# Altium schematic sheet Altium_Schematic.schdoc (part 2 of 6)
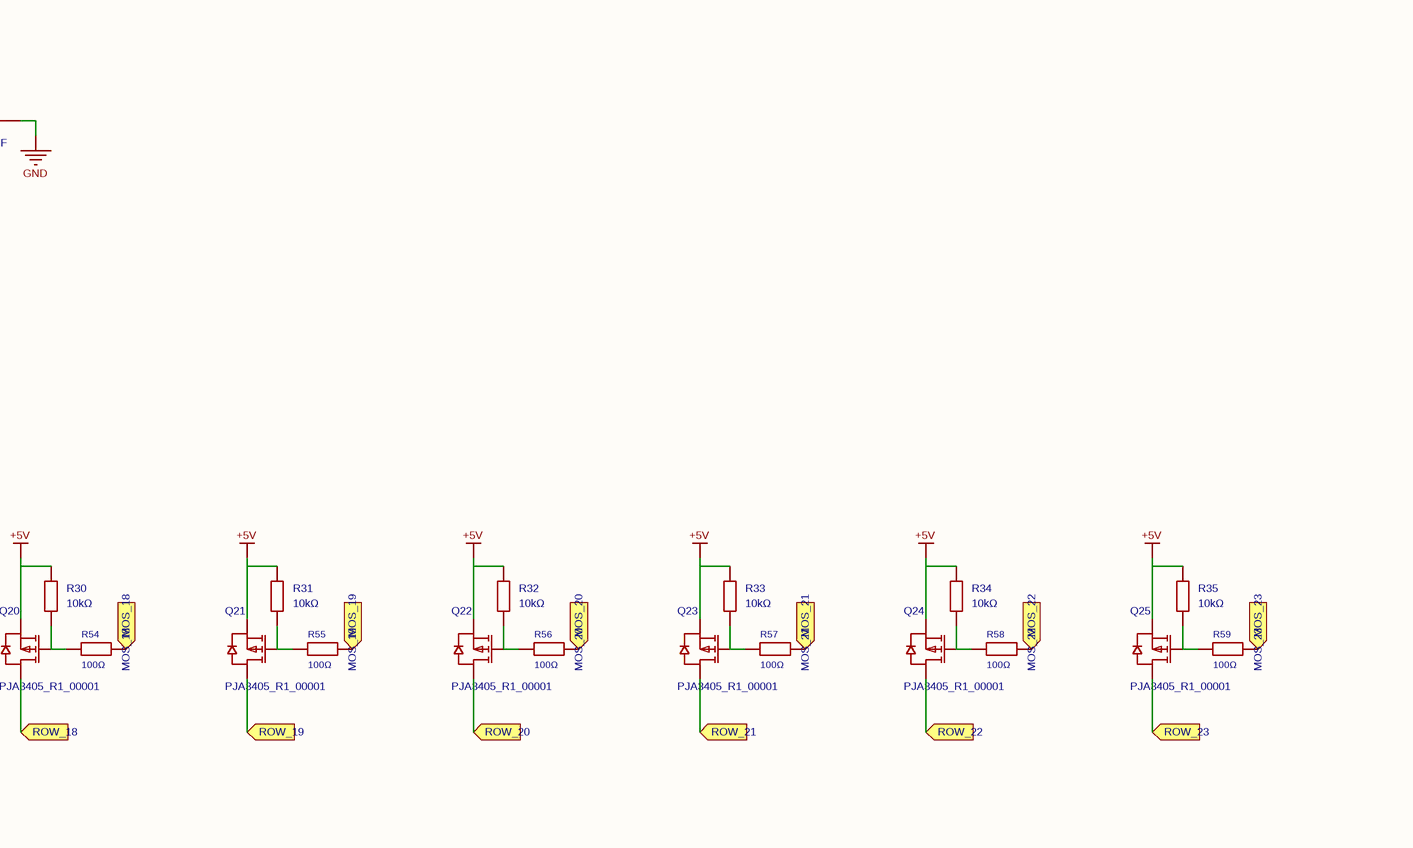
[diagram p12: Altium_Schematic.schdoc, bottom column 4 of 4]
## Parts
C1  1uF  [C0402]
C2  100nF  [C0402]
C3  1uF  [C0402]
C4  100nF  [C0402]
C5  100nF  [C0402]
C6  100nF  [C0402]
C7  100nF  [C0402]
C8  100nF  [C0402]
C9  1uF  [C0402]
C10  1uF  [C0402]
C11  1uF  [C0402]
C12  1uF  [C0402]
C13  1uF  [C0402]
C14  100nF  [C0402]
C15  100nF  [C0402]
C16  100nF  [C0402]
C17  10uF  [C0805]
C18  22uF  [C0805]
C19  10uF  [C0805]
C20  100nF  [C0402]
C21  100nF  [C0402]
D1  USBLC6-2SC6  [SOT-23-6_L2.9-W1.6-P0.95-LS2.8-BL]
H1  (no value)  [Top side pads]
H2  (no value)  [Top side pads]
LED1  16-213/BHC-AN1P2/3T  [LED0402-R-RD]  (value not drawn)
LED2  16-213/BHC-AN1P2/3T  [LED0402-R-RD]  (value not drawn)
LED3  16-213/BHC-AN1P2/3T  [LED0402-R-RD]  (value not drawn)
LED4  16-213/BHC-AN1P2/3T  [LED0402-R-RD]  (value not drawn)
LED5  16-213/BHC-AN1P2/3T  [LED0402-R-RD]  (value not drawn)
LED6  16-213/BHC-AN1P2/3T  [LED0402-R-RD]  (value not drawn)
LED7  16-213/BHC-AN1P2/3T  [LED0402-R-RD]  (value not drawn)
LED8  16-213/BHC-AN1P2/3T  [LED0402-R-RD]  (value not drawn)
LED9  16-213/BHC-AN1P2/3T  [LED0402-R-RD]  (value not drawn)
LED10  16-213/BHC-AN1P2/3T  [LED0402-R-RD]  (value not drawn)
LED11  16-213/BHC-AN1P2/3T  [LED0402-R-RD]  (value not drawn)
LED12  16-213/BHC-AN1P2/3T  [LED0402-R-RD]  (value not drawn)
LED13  16-213/BHC-AN1P2/3T  [LED0402-R-RD]  (value not drawn)
LED14  16-213/BHC-AN1P2/3T  [LED0402-R-RD]  (value not drawn)
LED15  16-213/BHC-AN1P2/3T  [LED0402-R-RD]  (value not drawn)
LED16  16-213/BHC-AN1P2/3T  [LED0402-R-RD]  (value not drawn)
LED17  16-213/BHC-AN1P2/3T  [LED0402-R-RD]  (value not drawn)
LED18  16-213/BHC-AN1P2/3T  [LED0402-R-RD]  (value not drawn)
LED19  16-213/BHC-AN1P2/3T  [LED0402-R-RD]  (value not drawn)
LED20  16-213/BHC-AN1P2/3T  [LED0402-R-RD]  (value not drawn)
LED21  16-213/BHC-AN1P2/3T  [LED0402-R-RD]  (value not drawn)
LED22  16-213/BHC-AN1P2/3T  [LED0402-R-RD]  (value not drawn)
LED23  16-213/BHC-AN1P2/3T  [LED0402-R-RD]  (value not drawn)
LED24  16-213/BHC-AN1P2/3T  [LED0402-R-RD]  (value not drawn)
LED25  16-213/BHC-AN1P2/3T  [LED0402-R-RD]  (value not drawn)
LED26  16-213/BHC-AN1P2/3T  [LED0402-R-RD]  (value not drawn)
LED27  16-213/BHC-AN1P2/3T  [LED0402-R-RD]  (value not drawn)
LED28  16-213/BHC-AN1P2/3T  [LED0402-R-RD]  (value not drawn)
LED29  16-213/BHC-AN1P2/3T  [LED0402-R-RD]  (value not drawn)
LED30  16-213/BHC-AN1P2/3T  [LED0402-R-RD]  (value not drawn)
LED31  16-213/BHC-AN1P2/3T  [LED0402-R-RD]  (value not drawn)
LED32  16-213/BHC-AN1P2/3T  [LED0402-R-RD]  (value not drawn)
LED33  16-213/BHC-AN1P2/3T  [LED0402-R-RD]  (value not drawn)
LED34  16-213/BHC-AN1P2/3T  [LED0402-R-RD]  (value not drawn)
LED35  16-213/BHC-AN1P2/3T  [LED0402-R-RD]  (value not drawn)
LED36  16-213/BHC-AN1P2/3T  [LED0402-R-RD]  (value not drawn)
LED37  16-213/BHC-AN1P2/3T  [LED0402-R-RD]  (value not drawn)
LED38  16-213/BHC-AN1P2/3T  [LED0402-R-RD]  (value not drawn)
LED39  16-213/BHC-AN1P2/3T  [LED0402-R-RD]  (value not drawn)
LED40  16-213/BHC-AN1P2/3T  [LED0402-R-RD]  (value not drawn)
LED41  16-213/BHC-AN1P2/3T  [LED0402-R-RD]  (value not drawn)
LED42  16-213/BHC-AN1P2/3T  [LED0402-R-RD]  (value not drawn)
LED43  16-213/BHC-AN1P2/3T  [LED0402-R-RD]  (value not drawn)
LED44  16-213/BHC-AN1P2/3T  [LED0402-R-RD]  (value not drawn)
LED45  16-213/BHC-AN1P2/3T  [LED0402-R-RD]  (value not drawn)
LED46  16-213/BHC-AN1P2/3T  [LED0402-R-RD]  (value not drawn)
LED47  16-213/BHC-AN1P2/3T  [LED0402-R-RD]  (value not drawn)
LED48  16-213/BHC-AN1P2/3T  [LED0402-R-RD]  (value not drawn)
LED49  16-213/BHC-AN1P2/3T  [LED0402-R-RD]  (value not drawn)
LED50  16-213/BHC-AN1P2/3T  [LED0402-R-RD]  (value not drawn)
LED51  16-213/BHC-AN1P2/3T  [LED0402-R-RD]  (value not drawn)
LED52  16-213/BHC-AN1P2/3T  [LED0402-R-RD]  (value not drawn)
LED53  16-213/BHC-AN1P2/3T  [LED0402-R-RD]  (value not drawn)
LED54  16-213/BHC-AN1P2/3T  [LED0402-R-RD]  (value not drawn)
LED55  16-213/BHC-AN1P2/3T  [LED0402-R-RD]  (value not drawn)
LED56  16-213/BHC-AN1P2/3T  [LED0402-R-RD]  (value not drawn)
LED57  16-213/BHC-AN1P2/3T  [LED0402-R-RD]  (value not drawn)
LED58  16-213/BHC-AN1P2/3T  [LED0402-R-RD]  (value not drawn)
LED59  16-213/BHC-AN1P2/3T  [LED0402-R-RD]  (value not drawn)
LED60  16-213/BHC-AN1P2/3T  [LED0402-R-RD]  (value not drawn)
LED61  16-213/BHC-AN1P2/3T  [LED0402-R-RD]  (value not drawn)
LED62  16-213/BHC-AN1P2/3T  [LED0402-R-RD]  (value not drawn)
LED63  16-213/BHC-AN1P2/3T  [LED0402-R-RD]  (value not drawn)
LED64  16-213/BHC-AN1P2/3T  [LED0402-R-RD]  (value not drawn)
LED65  16-213/BHC-AN1P2/3T  [LED0402-R-RD]  (value not drawn)
LED66  16-213/BHC-AN1P2/3T  [LED0402-R-RD]  (value not drawn)
LED67  16-213/BHC-AN1P2/3T  [LED0402-R-RD]  (value not drawn)
LED68  16-213/BHC-AN1P2/3T  [LED0402-R-RD]  (value not drawn)
LED69  16-213/BHC-AN1P2/3T  [LED0402-R-RD]  (value not drawn)
LED70  16-213/BHC-AN1P2/3T  [LED0402-R-RD]  (value not drawn)
LED71  16-213/BHC-AN1P2/3T  [LED0402-R-RD]  (value not drawn)
LED72  16-213/BHC-AN1P2/3T  [LED0402-R-RD]  (value not drawn)
LED73  16-213/BHC-AN1P2/3T  [LED0402-R-RD]  (value not drawn)
LED74  16-213/BHC-AN1P2/3T  [LED0402-R-RD]  (value not drawn)
LED75  16-213/BHC-AN1P2/3T  [LED0402-R-RD]  (value not drawn)
LED76  16-213/BHC-AN1P2/3T  [LED0402-R-RD]  (value not drawn)
LED77  16-213/BHC-AN1P2/3T  [LED0402-R-RD]  (value not drawn)
LED78  16-213/BHC-AN1P2/3T  [LED0402-R-RD]  (value not drawn)
LED79  16-213/BHC-AN1P2/3T  [LED0402-R-RD]  (value not drawn)
LED80  16-213/BHC-AN1P2/3T  [LED0402-R-RD]  (value not drawn)
LED81  16-213/BHC-AN1P2/3T  [LED0402-R-RD]  (value not drawn)
LED82  16-213/BHC-AN1P2/3T  [LED0402-R-RD]  (value not drawn)
LED83  16-213/BHC-AN1P2/3T  [LED0402-R-RD]  (value not drawn)
LED84  16-213/BHC-AN1P2/3T  [LED0402-R-RD]  (value not drawn)
LED85  16-213/BHC-AN1P2/3T  [LED0402-R-RD]  (value not drawn)
LED86  16-213/BHC-AN1P2/3T  [LED0402-R-RD]  (value not drawn)
LED87  16-213/BHC-AN1P2/3T  [LED0402-R-RD]  (value not drawn)
LED88  16-213/BHC-AN1P2/3T  [LED0402-R-RD]  (value not drawn)
LED89  16-213/BHC-AN1P2/3T  [LED0402-R-RD]  (value not drawn)
LED90  16-213/BHC-AN1P2/3T  [LED0402-R-RD]  (value not drawn)
LED91  16-213/BHC-AN1P2/3T  [LED0402-R-RD]  (value not drawn)
LED92  16-213/BHC-AN1P2/3T  [LED0402-R-RD]  (value not drawn)
LED93  16-213/BHC-AN1P2/3T  [LED0402-R-RD]  (value not drawn)
LED94  16-213/BHC-AN1P2/3T  [LED0402-R-RD]  (value not drawn)
LED95  16-213/BHC-AN1P2/3T  [LED0402-R-RD]  (value not drawn)
LED96  16-213/BHC-AN1P2/3T  [LED0402-R-RD]  (value not drawn)
LED97  16-213/BHC-AN1P2/3T  [LED0402-R-RD]  (value not drawn)
LED98  16-213/BHC-AN1P2/3T  [LED0402-R-RD]  (value not drawn)
LED99  16-213/BHC-AN1P2/3T  [LED0402-R-RD]  (value not drawn)
LED100  16-213/BHC-AN1P2/3T  [LED0402-R-RD]  (value not drawn)
LED101  16-213/BHC-AN1P2/3T  [LED0402-R-RD]  (value not drawn)
LED102  16-213/BHC-AN1P2/3T  [LED0402-R-RD]  (value not drawn)
LED103  16-213/BHC-AN1P2/3T  [LED0402-R-RD]  (value not drawn)
LED104  16-213/BHC-AN1P2/3T  [LED0402-R-RD]  (value not drawn)
LED105  16-213/BHC-AN1P2/3T  [LED0402-R-RD]  (value not drawn)
LED106  16-213/BHC-AN1P2/3T  [LED0402-R-RD]  (value not drawn)
LED107  16-213/BHC-AN1P2/3T  [LED0402-R-RD]  (value not drawn)
LED108  16-213/BHC-AN1P2/3T  [LED0402-R-RD]  (value not drawn)
LED109  16-213/BHC-AN1P2/3T  [LED0402-R-RD]  (value not drawn)
LED110  16-213/BHC-AN1P2/3T  [LED0402-R-RD]  (value not drawn)
LED111  16-213/BHC-AN1P2/3T  [LED0402-R-RD]  (value not drawn)
LED112  16-213/BHC-AN1P2/3T  [LED0402-R-RD]  (value not drawn)
LED113  16-213/BHC-AN1P2/3T  [LED0402-R-RD]  (value not drawn)
LED114  16-213/BHC-AN1P2/3T  [LED0402-R-RD]  (value not drawn)
LED115  16-213/BHC-AN1P2/3T  [LED0402-R-RD]  (value not drawn)
LED116  16-213/BHC-AN1P2/3T  [LED0402-R-RD]  (value not drawn)
LED117  16-213/BHC-AN1P2/3T  [LED0402-R-RD]  (value not drawn)
LED118  16-213/BHC-AN1P2/3T  [LED0402-R-RD]  (value not drawn)
LED119  16-213/BHC-AN1P2/3T  [LED0402-R-RD]  (value not drawn)
LED120  16-213/BHC-AN1P2/3T  [LED0402-R-RD]  (value not drawn)
LED121  16-213/BHC-AN1P2/3T  [LED0402-R-RD]  (value not drawn)
LED122  16-213/BHC-AN1P2/3T  [LED0402-R-RD]  (value not drawn)
LED123  16-213/BHC-AN1P2/3T  [LED0402-R-RD]  (value not drawn)
LED124  16-213/BHC-AN1P2/3T  [LED0402-R-RD]  (value not drawn)
LED125  16-213/BHC-AN1P2/3T  [LED0402-R-RD]  (value not drawn)
LED126  16-213/BHC-AN1P2/3T  [LED0402-R-RD]  (value not drawn)
LED127  16-213/BHC-AN1P2/3T  [LED0402-R-RD]  (value not drawn)
LED128  16-213/BHC-AN1P2/3T  [LED0402-R-RD]  (value not drawn)
LED129  16-213/BHC-AN1P2/3T  [LED0402-R-RD]  (value not drawn)
LED130  16-213/BHC-AN1P2/3T  [LED0402-R-RD]  (value not drawn)
LED131  16-213/BHC-AN1P2/3T  [LED0402-R-RD]  (value not drawn)
LED132  16-213/BHC-AN1P2/3T  [LED0402-R-RD]  (value not drawn)
LED133  16-213/BHC-AN1P2/3T  [LED0402-R-RD]  (value not drawn)
LED134  16-213/BHC-AN1P2/3T  [LED0402-R-RD]  (value not drawn)
LED135  16-213/BHC-AN1P2/3T  [LED0402-R-RD]  (value not drawn)
LED136  16-213/BHC-AN1P2/3T  [LED0402-R-RD]  (value not drawn)
LED137  16-213/BHC-AN1P2/3T  [LED0402-R-RD]  (value not drawn)
LED138  16-213/BHC-AN1P2/3T  [LED0402-R-RD]  (value not drawn)
LED139  16-213/BHC-AN1P2/3T  [LED0402-R-RD]  (value not drawn)
LED140  16-213/BHC-AN1P2/3T  [LED0402-R-RD]  (value not drawn)
LED141  16-213/BHC-AN1P2/3T  [LED0402-R-RD]  (value not drawn)
LED142  16-213/BHC-AN1P2/3T  [LED0402-R-RD]  (value not drawn)
LED143  16-213/BHC-AN1P2/3T  [LED0402-R-RD]  (value not drawn)
LED144  16-213/BHC-AN1P2/3T  [LED0402-R-RD]  (value not drawn)
LED145  16-213/BHC-AN1P2/3T  [LED0402-R-RD]  (value not drawn)
LED146  16-213/BHC-AN1P2/3T  [LED0402-R-RD]  (value not drawn)
LED147  16-213/BHC-AN1P2/3T  [LED0402-R-RD]  (value not drawn)
LED148  16-213/BHC-AN1P2/3T  [LED0402-R-RD]  (value not drawn)
LED149  16-213/BHC-AN1P2/3T  [LED0402-R-RD]  (value not drawn)
LED150  16-213/BHC-AN1P2/3T  [LED0402-R-RD]  (value not drawn)
LED151  16-213/BHC-AN1P2/3T  [LED0402-R-RD]  (value not drawn)
LED152  16-213/BHC-AN1P2/3T  [LED0402-R-RD]  (value not drawn)
LED153  16-213/BHC-AN1P2/3T  [LED0402-R-RD]  (value not drawn)
LED154  16-213/BHC-AN1P2/3T  [LED0402-R-RD]  (value not drawn)
LED155  16-213/BHC-AN1P2/3T  [LED0402-R-RD]  (value not drawn)
LED156  16-213/BHC-AN1P2/3T  [LED0402-R-RD]  (value not drawn)
LED157  16-213/BHC-AN1P2/3T  [LED0402-R-RD]  (value not drawn)
LED158  16-213/BHC-AN1P2/3T  [LED0402-R-RD]  (value not drawn)
LED159  16-213/BHC-AN1P2/3T  [LED0402-R-RD]  (value not drawn)
LED160  16-213/BHC-AN1P2/3T  [LED0402-R-RD]  (value not drawn)
LED161  16-213/BHC-AN1P2/3T  [LED0402-R-RD]  (value not drawn)
LED162  16-213/BHC-AN1P2/3T  [LED0402-R-RD]  (value not drawn)
LED163  16-213/BHC-AN1P2/3T  [LED0402-R-RD]  (value not drawn)
LED164  16-213/BHC-AN1P2/3T  [LED0402-R-RD]  (value not drawn)
LED165  16-213/BHC-AN1P2/3T  [LED0402-R-RD]  (value not drawn)
LED166  16-213/BHC-AN1P2/3T  [LED0402-R-RD]  (value not drawn)
LED167  16-213/BHC-AN1P2/3T  [LED0402-R-RD]  (value not drawn)
LED168  16-213/BHC-AN1P2/3T  [LED0402-R-RD]  (value not drawn)
LED169  16-213/BHC-AN1P2/3T  [LED0402-R-RD]  (value not drawn)
LED170  16-213/BHC-AN1P2/3T  [LED0402-R-RD]  (value not drawn)
LED171  16-213/BHC-AN1P2/3T  [LED0402-R-RD]  (value not drawn)
LED172  16-213/BHC-AN1P2/3T  [LED0402-R-RD]  (value not drawn)
LED173  16-213/BHC-AN1P2/3T  [LED0402-R-RD]  (value not drawn)
LED174  16-213/BHC-AN1P2/3T  [LED0402-R-RD]  (value not drawn)
LED175  16-213/BHC-AN1P2/3T  [LED0402-R-RD]  (value not drawn)
LED176  16-213/BHC-AN1P2/3T  [LED0402-R-RD]  (value not drawn)
LED177  16-213/BHC-AN1P2/3T  [LED0402-R-RD]  (value not drawn)
LED178  16-213/BHC-AN1P2/3T  [LED0402-R-RD]  (value not drawn)
LED179  16-213/BHC-AN1P2/3T  [LED0402-R-RD]  (value not drawn)
LED180  16-213/BHC-AN1P2/3T  [LED0402-R-RD]  (value not drawn)
LED181  16-213/BHC-AN1P2/3T  [LED0402-R-RD]  (value not drawn)
LED182  16-213/BHC-AN1P2/3T  [LED0402-R-RD]  (value not drawn)
LED183  16-213/BHC-AN1P2/3T  [LED0402-R-RD]  (value not drawn)
LED184  16-213/BHC-AN1P2/3T  [LED0402-R-RD]  (value not drawn)
LED185  16-213/BHC-AN1P2/3T  [LED0402-R-RD]  (value not drawn)
LED186  16-213/BHC-AN1P2/3T  [LED0402-R-RD]  (value not drawn)
LED187  16-213/BHC-AN1P2/3T  [LED0402-R-RD]  (value not drawn)
LED188  16-213/BHC-AN1P2/3T  [LED0402-R-RD]  (value not drawn)
LED189  16-213/BHC-AN1P2/3T  [LED0402-R-RD]  (value not drawn)
LED190  16-213/BHC-AN1P2/3T  [LED0402-R-RD]  (value not drawn)
LED191  16-213/BHC-AN1P2/3T  [LED0402-R-RD]  (value not drawn)
LED192  16-213/BHC-AN1P2/3T  [LED0402-R-RD]  (value not drawn)
LED193  16-213/BHC-AN1P2/3T  [LED0402-R-RD]  (value not drawn)
LED194  16-213/BHC-AN1P2/3T  [LED0402-R-RD]  (value not drawn)
LED195  16-213/BHC-AN1P2/3T  [LED0402-R-RD]  (value not drawn)
LED196  16-213/BHC-AN1P2/3T  [LED0402-R-RD]  (value not drawn)
LED197  16-213/BHC-AN1P2/3T  [LED0402-R-RD]  (value not drawn)
LED198  16-213/BHC-AN1P2/3T  [LED0402-R-RD]  (value not drawn)
LED199  16-213/BHC-AN1P2/3T  [LED0402-R-RD]  (value not drawn)
LED200  16-213/BHC-AN1P2/3T  [LED0402-R-RD]  (value not drawn)
LED201  16-213/BHC-AN1P2/3T  [LED0402-R-RD]  (value not drawn)
LED202  16-213/BHC-AN1P2/3T  [LED0402-R-RD]  (value not drawn)
LED203  16-213/BHC-AN1P2/3T  [LED0402-R-RD]  (value not drawn)
LED204  16-213/BHC-AN1P2/3T  [LED0402-R-RD]  (value not drawn)
LED205  16-213/BHC-AN1P2/3T  [LED0402-R-RD]  (value not drawn)
LED206  16-213/BHC-AN1P2/3T  [LED0402-R-RD]  (value not drawn)
LED207  16-213/BHC-AN1P2/3T  [LED0402-R-RD]  (value not drawn)
LED208  16-213/BHC-AN1P2/3T  [LED0402-R-RD]  (value not drawn)
LED209  16-213/BHC-AN1P2/3T  [LED0402-R-RD]  (value not drawn)
LED210  16-213/BHC-AN1P2/3T  [LED0402-R-RD]  (value not drawn)
LED211  16-213/BHC-AN1P2/3T  [LED0402-R-RD]  (value not drawn)
LED212  16-213/BHC-AN1P2/3T  [LED0402-R-RD]  (value not drawn)
LED213  16-213/BHC-AN1P2/3T  [LED0402-R-RD]  (value not drawn)
LED214  16-213/BHC-AN1P2/3T  [LED0402-R-RD]  (value not drawn)
LED215  16-213/BHC-AN1P2/3T  [LED0402-R-RD]  (value not drawn)
LED216  16-213/BHC-AN1P2/3T  [LED0402-R-RD]  (value not drawn)
LED217  16-213/BHC-AN1P2/3T  [LED0402-R-RD]  (value not drawn)
LED218  16-213/BHC-AN1P2/3T  [LED0402-R-RD]  (value not drawn)
LED219  16-213/BHC-AN1P2/3T  [LED0402-R-RD]  (value not drawn)
LED220  16-213/BHC-AN1P2/3T  [LED0402-R-RD]  (value not drawn)
LED221  16-213/BHC-AN1P2/3T  [LED0402-R-RD]  (value not drawn)
LED222  16-213/BHC-AN1P2/3T  [LED0402-R-RD]  (value not drawn)
LED223  16-213/BHC-AN1P2/3T  [LED0402-R-RD]  (value not drawn)
LED224  16-213/BHC-AN1P2/3T  [LED0402-R-RD]  (value not drawn)
LED225  16-213/BHC-AN1P2/3T  [LED0402-R-RD]  (value not drawn)
LED226  16-213/BHC-AN1P2/3T  [LED0402-R-RD]  (value not drawn)
LED227  16-213/BHC-AN1P2/3T  [LED0402-R-RD]  (value not drawn)
LED228  16-213/BHC-AN1P2/3T  [LED0402-R-RD]  (value not drawn)
LED229  16-213/BHC-AN1P2/3T  [LED0402-R-RD]  (value not drawn)
LED230  16-213/BHC-AN1P2/3T  [LED0402-R-RD]  (value not drawn)
LED231  16-213/BHC-AN1P2/3T  [LED0402-R-RD]  (value not drawn)
LED232  16-213/BHC-AN1P2/3T  [LED0402-R-RD]  (value not drawn)
LED233  16-213/BHC-AN1P2/3T  [LED0402-R-RD]  (value not drawn)
LED234  16-213/BHC-AN1P2/3T  [LED0402-R-RD]  (value not drawn)
LED235  16-213/BHC-AN1P2/3T  [LED0402-R-RD]  (value not drawn)
LED236  16-213/BHC-AN1P2/3T  [LED0402-R-RD]  (value not drawn)
LED237  16-213/BHC-AN1P2/3T  [LED0402-R-RD]  (value not drawn)
LED238  16-213/BHC-AN1P2/3T  [LED0402-R-RD]  (value not drawn)
LED239  16-213/BHC-AN1P2/3T  [LED0402-R-RD]  (value not drawn)
LED240  16-213/BHC-AN1P2/3T  [LED0402-R-RD]  (value not drawn)
LED241  16-213/BHC-AN1P2/3T  [LED0402-R-RD]  (value not drawn)
LED242  16-213/BHC-AN1P2/3T  [LED0402-R-RD]  (value not drawn)
LED243  16-213/BHC-AN1P2/3T  [LED0402-R-RD]  (value not drawn)
LED244  16-213/BHC-AN1P2/3T  [LED0402-R-RD]  (value not drawn)
LED245  16-213/BHC-AN1P2/3T  [LED0402-R-RD]  (value not drawn)
LED246  16-213/BHC-AN1P2/3T  [LED0402-R-RD]  (value not drawn)
LED247  16-213/BHC-AN1P2/3T  [LED0402-R-RD]  (value not drawn)
LED248  16-213/BHC-AN1P2/3T  [LED0402-R-RD]  (value not drawn)
LED249  16-213/BHC-AN1P2/3T  [LED0402-R-RD]  (value not drawn)
LED250  16-213/BHC-AN1P2/3T  [LED0402-R-RD]  (value not drawn)
LED251  16-213/BHC-AN1P2/3T  [LED0402-R-RD]  (value not drawn)
LED252  16-213/BHC-AN1P2/3T  [LED0402-R-RD]  (value not drawn)
LED253  16-213/BHC-AN1P2/3T  [LED0402-R-RD]  (value not drawn)
LED254  16-213/BHC-AN1P2/3T  [LED0402-R-RD]  (value not drawn)
LED255  16-213/BHC-AN1P2/3T  [LED0402-R-RD]  (value not drawn)
LED256  16-213/BHC-AN1P2/3T  [LED0402-R-RD]  (value not drawn)
LED257  16-213/BHC-AN1P2/3T  [LED0402-R-RD]  (value not drawn)
LED258  16-213/BHC-AN1P2/3T  [LED0402-R-RD]  (value not drawn)
LED259  16-213/BHC-AN1P2/3T  [LED0402-R-RD]  (value not drawn)
LED260  16-213/BHC-AN1P2/3T  [LED0402-R-RD]  (value not drawn)
LED261  16-213/BHC-AN1P2/3T  [LED0402-R-RD]  (value not drawn)
LED262  16-213/BHC-AN1P2/3T  [LED0402-R-RD]  (value not drawn)
LED263  16-213/BHC-AN1P2/3T  [LED0402-R-RD]  (value not drawn)
LED264  16-213/BHC-AN1P2/3T  [LED0402-R-RD]  (value not drawn)
LED265  16-213/BHC-AN1P2/3T  [LED0402-R-RD]  (value not drawn)
LED266  16-213/BHC-AN1P2/3T  [LED0402-R-RD]  (value not drawn)
LED267  16-213/BHC-AN1P2/3T  [LED0402-R-RD]  (value not drawn)
LED268  16-213/BHC-AN1P2/3T  [LED0402-R-RD]  (value not drawn)
LED269  16-213/BHC-AN1P2/3T  [LED0402-R-RD]  (value not drawn)
LED270  16-213/BHC-AN1P2/3T  [LED0402-R-RD]  (value not drawn)
LED271  16-213/BHC-AN1P2/3T  [LED0402-R-RD]  (value not drawn)
LED272  16-213/BHC-AN1P2/3T  [LED0402-R-RD]  (value not drawn)
LED273  16-213/BHC-AN1P2/3T  [LED0402-R-RD]  (value not drawn)
LED274  16-213/BHC-AN1P2/3T  [LED0402-R-RD]  (value not drawn)
LED275  16-213/BHC-AN1P2/3T  [LED0402-R-RD]  (value not drawn)
LED276  16-213/BHC-AN1P2/3T  [LED0402-R-RD]  (value not drawn)
LED277  16-213/BHC-AN1P2/3T  [LED0402-R-RD]  (value not drawn)
LED278  16-213/BHC-AN1P2/3T  [LED0402-R-RD]  (value not drawn)
LED279  16-213/BHC-AN1P2/3T  [LED0402-R-RD]  (value not drawn)
LED280  16-213/BHC-AN1P2/3T  [LED0402-R-RD]  (value not drawn)
LED281  16-213/BHC-AN1P2/3T  [LED0402-R-RD]  (value not drawn)
LED282  16-213/BHC-AN1P2/3T  [LED0402-R-RD]  (value not drawn)
LED283  16-213/BHC-AN1P2/3T  [LED0402-R-RD]  (value not drawn)
LED284  16-213/BHC-AN1P2/3T  [LED0402-R-RD]  (value not drawn)
LED285  16-213/BHC-AN1P2/3T  [LED0402-R-RD]  (value not drawn)
LED286  16-213/BHC-AN1P2/3T  [LED0402-R-RD]  (value not drawn)
LED287  16-213/BHC-AN1P2/3T  [LED0402-R-RD]  (value not drawn)
LED288  16-213/BHC-AN1P2/3T  [LED0402-R-RD]  (value not drawn)
LED289  16-213/BHC-AN1P2/3T  [LED0402-R-RD]  (value not drawn)
LED290  16-213/BHC-AN1P2/3T  [LED0402-R-RD]  (value not drawn)
LED291  16-213/BHC-AN1P2/3T  [LED0402-R-RD]  (value not drawn)
LED292  16-213/BHC-AN1P2/3T  [LED0402-R-RD]  (value not drawn)
LED293  16-213/BHC-AN1P2/3T  [LED0402-R-RD]  (value not drawn)
LED294  16-213/BHC-AN1P2/3T  [LED0402-R-RD]  (value not drawn)
LED295  16-213/BHC-AN1P2/3T  [LED0402-R-RD]  (value not drawn)
LED296  16-213/BHC-AN1P2/3T  [LED0402-R-RD]  (value not drawn)
LED297  16-213/BHC-AN1P2/3T  [LED0402-R-RD]  (value not drawn)
LED298  16-213/BHC-AN1P2/3T  [LED0402-R-RD]  (value not drawn)
LED299  16-213/BHC-AN1P2/3T  [LED0402-R-RD]  (value not drawn)
LED300  16-213/BHC-AN1P2/3T  [LED0402-R-RD]  (value not drawn)
LED301  16-213/BHC-AN1P2/3T  [LED0402-R-RD]  (value not drawn)
LED302  16-213/BHC-AN1P2/3T  [LED0402-R-RD]  (value not drawn)
LED303  16-213/BHC-AN1P2/3T  [LED0402-R-RD]  (value not drawn)
LED304  16-213/BHC-AN1P2/3T  [LED0402-R-RD]  (value not drawn)
LED305  16-213/BHC-AN1P2/3T  [LED0402-R-RD]  (value not drawn)
LED306  16-213/BHC-AN1P2/3T  [LED0402-R-RD]  (value not drawn)
LED307  16-213/BHC-AN1P2/3T  [LED0402-R-RD]  (value not drawn)
LED308  16-213/BHC-AN1P2/3T  [LED0402-R-RD]  (value not drawn)
LED309  16-213/BHC-AN1P2/3T  [LED0402-R-RD]  (value not drawn)
LED310  16-213/BHC-AN1P2/3T  [LED0402-R-RD]  (value not drawn)
LED311  16-213/BHC-AN1P2/3T  [LED0402-R-RD]  (value not drawn)
LED312  16-213/BHC-AN1P2/3T  [LED0402-R-RD]  (value not drawn)
LED313  16-213/BHC-AN1P2/3T  [LED0402-R-RD]  (value not drawn)
LED314  16-213/BHC-AN1P2/3T  [LED0402-R-RD]  (value not drawn)
LED315  16-213/BHC-AN1P2/3T  [LED0402-R-RD]  (value not drawn)
LED316  16-213/BHC-AN1P2/3T  [LED0402-R-RD]  (value not drawn)
LED317  16-213/BHC-AN1P2/3T  [LED0402-R-RD]  (value not drawn)
LED318  16-213/BHC-AN1P2/3T  [LED0402-R-RD]  (value not drawn)
LED319  16-213/BHC-AN1P2/3T  [LED0402-R-RD]  (value not drawn)
LED320  16-213/BHC-AN1P2/3T  [LED0402-R-RD]  (value not drawn)
LED321  16-213/BHC-AN1P2/3T  [LED0402-R-RD]  (value not drawn)
LED322  16-213/BHC-AN1P2/3T  [LED0402-R-RD]  (value not drawn)
LED323  16-213/BHC-AN1P2/3T  [LED0402-R-RD]  (value not drawn)
LED324  16-213/BHC-AN1P2/3T  [LED0402-R-RD]  (value not drawn)
LED325  16-213/BHC-AN1P2/3T  [LED0402-R-RD]  (value not drawn)
LED326  16-213/BHC-AN1P2/3T  [LED0402-R-RD]  (value not drawn)
LED327  16-213/BHC-AN1P2/3T  [LED0402-R-RD]  (value not drawn)
LED328  16-213/BHC-AN1P2/3T  [LED0402-R-RD]  (value not drawn)
LED329  16-213/BHC-AN1P2/3T  [LED0402-R-RD]  (value not drawn)
LED330  16-213/BHC-AN1P2/3T  [LED0402-R-RD]  (value not drawn)
LED331  16-213/BHC-AN1P2/3T  [LED0402-R-RD]  (value not drawn)
LED332  16-213/BHC-AN1P2/3T  [LED0402-R-RD]  (value not drawn)
LED333  16-213/BHC-AN1P2/3T  [LED0402-R-RD]  (value not drawn)
LED334  16-213/BHC-AN1P2/3T  [LED0402-R-RD]  (value not drawn)
LED335  16-213/BHC-AN1P2/3T  [LED0402-R-RD]  (value not drawn)
LED336  16-213/BHC-AN1P2/3T  [LED0402-R-RD]  (value not drawn)
LED337  16-213/BHC-AN1P2/3T  [LED0402-R-RD]  (value not drawn)
LED338  16-213/BHC-AN1P2/3T  [LED0402-R-RD]  (value not drawn)
LED339  16-213/BHC-AN1P2/3T  [LED0402-R-RD]  (value not drawn)
LED340  16-213/BHC-AN1P2/3T  [LED0402-R-RD]  (value not drawn)
LED341  16-213/BHC-AN1P2/3T  [LED0402-R-RD]  (value not drawn)
LED342  16-213/BHC-AN1P2/3T  [LED0402-R-RD]  (value not drawn)
LED343  16-213/BHC-AN1P2/3T  [LED0402-R-RD]  (value not drawn)
LED344  16-213/BHC-AN1P2/3T  [LED0402-R-RD]  (value not drawn)
LED345  16-213/BHC-AN1P2/3T  [LED0402-R-RD]  (value not drawn)
LED346  16-213/BHC-AN1P2/3T  [LED0402-R-RD]  (value not drawn)
LED347  16-213/BHC-AN1P2/3T  [LED0402-R-RD]  (value not drawn)
LED348  16-213/BHC-AN1P2/3T  [LED0402-R-RD]  (value not drawn)
LED349  16-213/BHC-AN1P2/3T  [LED0402-R-RD]  (value not drawn)
LED350  16-213/BHC-AN1P2/3T  [LED0402-R-RD]  (value not drawn)
LED351  16-213/BHC-AN1P2/3T  [LED0402-R-RD]  (value not drawn)
LED352  16-213/BHC-AN1P2/3T  [LED0402-R-RD]  (value not drawn)
LED353  16-213/BHC-AN1P2/3T  [LED0402-R-RD]  (value not drawn)
LED354  16-213/BHC-AN1P2/3T  [LED0402-R-RD]  (value not drawn)
LED355  16-213/BHC-AN1P2/3T  [LED0402-R-RD]  (value not drawn)
LED356  16-213/BHC-AN1P2/3T  [LED0402-R-RD]  (value not drawn)
LED357  16-213/BHC-AN1P2/3T  [LED0402-R-RD]  (value not drawn)
LED358  16-213/BHC-AN1P2/3T  [LED0402-R-RD]  (value not drawn)
LED359  16-213/BHC-AN1P2/3T  [LED0402-R-RD]  (value not drawn)
LED360  16-213/BHC-AN1P2/3T  [LED0402-R-RD]  (value not drawn)
LED361  16-213/BHC-AN1P2/3T  [LED0402-R-RD]  (value not drawn)
LED362  16-213/BHC-AN1P2/3T  [LED0402-R-RD]  (value not drawn)
LED363  16-213/BHC-AN1P2/3T  [LED0402-R-RD]  (value not drawn)
LED364  16-213/BHC-AN1P2/3T  [LED0402-R-RD]  (value not drawn)
LED365  16-213/BHC-AN1P2/3T  [LED0402-R-RD]  (value not drawn)
LED366  16-213/BHC-AN1P2/3T  [LED0402-R-RD]  (value not drawn)
LED367  16-213/BHC-AN1P2/3T  [LED0402-R-RD]  (value not drawn)
LED368  16-213/BHC-AN1P2/3T  [LED0402-R-RD]  (value not drawn)
LED369  16-213/BHC-AN1P2/3T  [LED0402-R-RD]  (value not drawn)
LED370  16-213/BHC-AN1P2/3T  [LED0402-R-RD]  (value not drawn)
LED371  16-213/BHC-AN1P2/3T  [LED0402-R-RD]  (value not drawn)
LED372  16-213/BHC-AN1P2/3T  [LED0402-R-RD]  (value not drawn)
LED373  16-213/BHC-AN1P2/3T  [LED0402-R-RD]  (value not drawn)
LED374  16-213/BHC-AN1P2/3T  [LED0402-R-RD]  (value not drawn)
LED375  16-213/BHC-AN1P2/3T  [LED0402-R-RD]  (value not drawn)
LED376  16-213/BHC-AN1P2/3T  [LED0402-R-RD]  (value not drawn)
LED377  16-213/BHC-AN1P2/3T  [LED0402-R-RD]  (value not drawn)
LED378  16-213/BHC-AN1P2/3T  [LED0402-R-RD]  (value not drawn)
LED379  16-213/BHC-AN1P2/3T  [LED0402-R-RD]  (value not drawn)
LED380  16-213/BHC-AN1P2/3T  [LED0402-R-RD]  (value not drawn)
LED381  16-213/BHC-AN1P2/3T  [LED0402-R-RD]  (value not drawn)
LED382  16-213/BHC-AN1P2/3T  [LED0402-R-RD]  (value not drawn)
LED383  16-213/BHC-AN1P2/3T  [LED0402-R-RD]  (value not drawn)
LED384  16-213/BHC-AN1P2/3T  [LED0402-R-RD]  (value not drawn)
LED385  16-213/BHC-AN1P2/3T  [LED0402-R-RD]  (value not drawn)
LED386  16-213/BHC-AN1P2/3T  [LED0402-R-RD]  (value not drawn)
LED387  16-213/BHC-AN1P2/3T  [LED0402-R-RD]  (value not drawn)
LED388  16-213/BHC-AN1P2/3T  [LED0402-R-RD]  (value not drawn)
LED389  16-213/BHC-AN1P2/3T  [LED0402-R-RD]  (value not drawn)
LED390  16-213/BHC-AN1P2/3T  [LED0402-R-RD]  (value not drawn)
LED391  16-213/BHC-AN1P2/3T  [LED0402-R-RD]  (value not drawn)
LED392  16-213/BHC-AN1P2/3T  [LED0402-R-RD]  (value not drawn)
LED393  16-213/BHC-AN1P2/3T  [LED0402-R-RD]  (value not drawn)
LED394  16-213/BHC-AN1P2/3T  [LED0402-R-RD]  (value not drawn)
LED395  16-213/BHC-AN1P2/3T  [LED0402-R-RD]  (value not drawn)
LED396  16-213/BHC-AN1P2/3T  [LED0402-R-RD]  (value not drawn)
LED397  16-213/BHC-AN1P2/3T  [LED0402-R-RD]  (value not drawn)
LED398  16-213/BHC-AN1P2/3T  [LED0402-R-RD]  (value not drawn)
LED399  16-213/BHC-AN1P2/3T  [LED0402-R-RD]  (value not drawn)
LED400  16-213/BHC-AN1P2/3T  [LED0402-R-RD]  (value not drawn)
LED401  16-213/BHC-AN1P2/3T  [LED0402-R-RD]  (value not drawn)
LED402  16-213/BHC-AN1P2/3T  [LED0402-R-RD]  (value not drawn)
LED403  16-213/BHC-AN1P2/3T  [LED0402-R-RD]  (value not drawn)
LED404  16-213/BHC-AN1P2/3T  [LED0402-R-RD]  (value not drawn)
LED405  16-213/BHC-AN1P2/3T  [LED0402-R-RD]  (value not drawn)
LED406  16-213/BHC-AN1P2/3T  [LED0402-R-RD]  (value not drawn)
LED407  16-213/BHC-AN1P2/3T  [LED0402-R-RD]  (value not drawn)
LED408  16-213/BHC-AN1P2/3T  [LED0402-R-RD]  (value not drawn)
LED409  16-213/BHC-AN1P2/3T  [LED0402-R-RD]  (value not drawn)
LED410  16-213/BHC-AN1P2/3T  [LED0402-R-RD]  (value not drawn)
LED411  16-213/BHC-AN1P2/3T  [LED0402-R-RD]  (value not drawn)
LED412  16-213/BHC-AN1P2/3T  [LED0402-R-RD]  (value not drawn)
LED413  16-213/BHC-AN1P2/3T  [LED0402-R-RD]  (value not drawn)
LED414  16-213/BHC-AN1P2/3T  [LED0402-R-RD]  (value not drawn)
LED415  16-213/BHC-AN1P2/3T  [LED0402-R-RD]  (value not drawn)
LED416  16-213/BHC-AN1P2/3T  [LED0402-R-RD]  (value not drawn)
LED417  16-213/BHC-AN1P2/3T  [LED0402-R-RD]  (value not drawn)
LED418  16-213/BHC-AN1P2/3T  [LED0402-R-RD]  (value not drawn)
LED419  16-213/BHC-AN1P2/3T  [LED0402-R-RD]  (value not drawn)
LED420  16-213/BHC-AN1P2/3T  [LED0402-R-RD]  (value not drawn)
LED421  16-213/BHC-AN1P2/3T  [LED0402-R-RD]  (value not drawn)
LED422  16-213/BHC-AN1P2/3T  [LED0402-R-RD]  (value not drawn)
LED423  16-213/BHC-AN1P2/3T  [LED0402-R-RD]  (value not drawn)
LED424  16-213/BHC-AN1P2/3T  [LED0402-R-RD]  (value not drawn)
LED425  16-213/BHC-AN1P2/3T  [LED0402-R-RD]  (value not drawn)
LED426  16-213/BHC-AN1P2/3T  [LED0402-R-RD]  (value not drawn)
LED427  16-213/BHC-AN1P2/3T  [LED0402-R-RD]  (value not drawn)
LED428  16-213/BHC-AN1P2/3T  [LED0402-R-RD]  (value not drawn)
LED429  16-213/BHC-AN1P2/3T  [LED0402-R-RD]  (value not drawn)
LED430  16-213/BHC-AN1P2/3T  [LED0402-R-RD]  (value not drawn)
LED431  16-213/BHC-AN1P2/3T  [LED0402-R-RD]  (value not drawn)
LED432  16-213/BHC-AN1P2/3T  [LED0402-R-RD]  (value not drawn)
LED433  16-213/BHC-AN1P2/3T  [LED0402-R-RD]  (value not drawn)
LED434  16-213/BHC-AN1P2/3T  [LED0402-R-RD]  (value not drawn)
LED435  16-213/BHC-AN1P2/3T  [LED0402-R-RD]  (value not drawn)
LED436  16-213/BHC-AN1P2/3T  [LED0402-R-RD]  (value not drawn)
LED437  16-213/BHC-AN1P2/3T  [LED0402-R-RD]  (value not drawn)
LED438  16-213/BHC-AN1P2/3T  [LED0402-R-RD]  (value not drawn)
LED439  16-213/BHC-AN1P2/3T  [LED0402-R-RD]  (value not drawn)
LED440  16-213/BHC-AN1P2/3T  [LED0402-R-RD]  (value not drawn)
LED441  16-213/BHC-AN1P2/3T  [LED0402-R-RD]  (value not drawn)
LED442  16-213/BHC-AN1P2/3T  [LED0402-R-RD]  (value not drawn)
LED443  16-213/BHC-AN1P2/3T  [LED0402-R-RD]  (value not drawn)
LED444  16-213/BHC-AN1P2/3T  [LED0402-R-RD]  (value not drawn)
LED445  16-213/BHC-AN1P2/3T  [LED0402-R-RD]  (value not drawn)
LED446  16-213/BHC-AN1P2/3T  [LED0402-R-RD]  (value not drawn)
LED447  16-213/BHC-AN1P2/3T  [LED0402-R-RD]  (value not drawn)
LED448  16-213/BHC-AN1P2/3T  [LED0402-R-RD]  (value not drawn)
LED449  16-213/BHC-AN1P2/3T  [LED0402-R-RD]  (value not drawn)
LED450  16-213/BHC-AN1P2/3T  [LED0402-R-RD]  (value not drawn)
LED451  16-213/BHC-AN1P2/3T  [LED0402-R-RD]  (value not drawn)
LED452  16-213/BHC-AN1P2/3T  [LED0402-R-RD]  (value not drawn)
LED453  16-213/BHC-AN1P2/3T  [LED0402-R-RD]  (value not drawn)
LED454  16-213/BHC-AN1P2/3T  [LED0402-R-RD]  (value not drawn)
LED455  16-213/BHC-AN1P2/3T  [LED0402-R-RD]  (value not drawn)
LED456  16-213/BHC-AN1P2/3T  [LED0402-R-RD]  (value not drawn)
LED457  16-213/BHC-AN1P2/3T  [LED0402-R-RD]  (value not drawn)
LED458  16-213/BHC-AN1P2/3T  [LED0402-R-RD]  (value not drawn)
LED459  16-213/BHC-AN1P2/3T  [LED0402-R-RD]  (value not drawn)
LED460  16-213/BHC-AN1P2/3T  [LED0402-R-RD]  (value not drawn)
LED461  16-213/BHC-AN1P2/3T  [LED0402-R-RD]  (value not drawn)
LED462  16-213/BHC-AN1P2/3T  [LED0402-R-RD]  (value not drawn)
LED463  16-213/BHC-AN1P2/3T  [LED0402-R-RD]  (value not drawn)
LED464  16-213/BHC-AN1P2/3T  [LED0402-R-RD]  (value not drawn)
LED465  16-213/BHC-AN1P2/3T  [LED0402-R-RD]  (value not drawn)
LED466  16-213/BHC-AN1P2/3T  [LED0402-R-RD]  (value not drawn)
LED467  16-213/BHC-AN1P2/3T  [LED0402-R-RD]  (value not drawn)
LED468  16-213/BHC-AN1P2/3T  [LED0402-R-RD]  (value not drawn)
LED469  16-213/BHC-AN1P2/3T  [LED0402-R-RD]  (value not drawn)
LED470  16-213/BHC-AN1P2/3T  [LED0402-R-RD]  (value not drawn)
LED471  16-213/BHC-AN1P2/3T  [LED0402-R-RD]  (value not drawn)
LED472  16-213/BHC-AN1P2/3T  [LED0402-R-RD]  (value not drawn)
LED473  16-213/BHC-AN1P2/3T  [LED0402-R-RD]  (value not drawn)
LED474  16-213/BHC-AN1P2/3T  [LED0402-R-RD]  (value not drawn)
LED475  16-213/BHC-AN1P2/3T  [LED0402-R-RD]  (value not drawn)
LED476  16-213/BHC-AN1P2/3T  [LED0402-R-RD]  (value not drawn)
LED477  16-213/BHC-AN1P2/3T  [LED0402-R-RD]  (value not drawn)
LED478  16-213/BHC-AN1P2/3T  [LED0402-R-RD]  (value not drawn)
LED479  16-213/BHC-AN1P2/3T  [LED0402-R-RD]  (value not drawn)
LED480  16-213/BHC-AN1P2/3T  [LED0402-R-RD]  (value not drawn)
LED481  16-213/BHC-AN1P2/3T  [LED0402-R-RD]  (value not drawn)
LED482  16-213/BHC-AN1P2/3T  [LED0402-R-RD]  (value not drawn)
LED483  16-213/BHC-AN1P2/3T  [LED0402-R-RD]  (value not drawn)
LED484  16-213/BHC-AN1P2/3T  [LED0402-R-RD]  (value not drawn)
LED485  16-213/BHC-AN1P2/3T  [LED0402-R-RD]  (value not drawn)
LED486  16-213/BHC-AN1P2/3T  [LED0402-R-RD]  (value not drawn)
LED487  16-213/BHC-AN1P2/3T  [LED0402-R-RD]  (value not drawn)
LED488  16-213/BHC-AN1P2/3T  [LED0402-R-RD]  (value not drawn)
LED489  16-213/BHC-AN1P2/3T  [LED0402-R-RD]  (value not drawn)
LED490  16-213/BHC-AN1P2/3T  [LED0402-R-RD]  (value not drawn)
LED491  16-213/BHC-AN1P2/3T  [LED0402-R-RD]  (value not drawn)
LED492  16-213/BHC-AN1P2/3T  [LED0402-R-RD]  (value not drawn)
LED493  16-213/BHC-AN1P2/3T  [LED0402-R-RD]  (value not drawn)
LED494  16-213/BHC-AN1P2/3T  [LED0402-R-RD]  (value not drawn)
LED495  16-213/BHC-AN1P2/3T  [LED0402-R-RD]  (value not drawn)
LED496  16-213/BHC-AN1P2/3T  [LED0402-R-RD]  (value not drawn)
LED497  16-213/BHC-AN1P2/3T  [LED0402-R-RD]  (value not drawn)
LED498  16-213/BHC-AN1P2/3T  [LED0402-R-RD]  (value not drawn)
LED499  16-213/BHC-AN1P2/3T  [LED0402-R-RD]  (value not drawn)
LED500  16-213/BHC-AN1P2/3T  [LED0402-R-RD]  (value not drawn)
LED501  16-213/BHC-AN1P2/3T  [LED0402-R-RD]  (value not drawn)
LED502  16-213/BHC-AN1P2/3T  [LED0402-R-RD]  (value not drawn)
LED503  16-213/BHC-AN1P2/3T  [LED0402-R-RD]  (value not drawn)
LED504  16-213/BHC-AN1P2/3T  [LED0402-R-RD]  (value not drawn)
LED505  16-213/BHC-AN1P2/3T  [LED0402-R-RD]  (value not drawn)
LED506  16-213/BHC-AN1P2/3T  [LED0402-R-RD]  (value not drawn)
LED507  16-213/BHC-AN1P2/3T  [LED0402-R-RD]  (value not drawn)
LED508  16-213/BHC-AN1P2/3T  [LED0402-R-RD]  (value not drawn)
LED509  16-213/BHC-AN1P2/3T  [LED0402-R-RD]  (value not drawn)
LED510  16-213/BHC-AN1P2/3T  [LED0402-R-RD]  (value not drawn)
LED511  16-213/BHC-AN1P2/3T  [LED0402-R-RD]  (value not drawn)
LED512  16-213/BHC-AN1P2/3T  [LED0402-R-RD]  (value not drawn)
LED513  16-213/BHC-AN1P2/3T  [LED0402-R-RD]  (value not drawn)
LED514  16-213/BHC-AN1P2/3T  [LED0402-R-RD]  (value not drawn)
LED515  16-213/BHC-AN1P2/3T  [LED0402-R-RD]  (value not drawn)
LED516  16-213/BHC-AN1P2/3T  [LED0402-R-RD]  (value not drawn)
LED517  16-213/BHC-AN1P2/3T  [LED0402-R-RD]  (value not drawn)
LED518  16-213/BHC-AN1P2/3T  [LED0402-R-RD]  (value not drawn)
LED519  16-213/BHC-AN1P2/3T  [LED0402-R-RD]  (value not drawn)
LED520  16-213/BHC-AN1P2/3T  [LED0402-R-RD]  (value not drawn)
LED521  16-213/BHC-AN1P2/3T  [LED0402-R-RD]  (value not drawn)
LED522  16-213/BHC-AN1P2/3T  [LED0402-R-RD]  (value not drawn)
LED523  16-213/BHC-AN1P2/3T  [LED0402-R-RD]  (value not drawn)
LED524  16-213/BHC-AN1P2/3T  [LED0402-R-RD]  (value not drawn)
LED525  16-213/BHC-AN1P2/3T  [LED0402-R-RD]  (value not drawn)
LED526  16-213/BHC-AN1P2/3T  [LED0402-R-RD]  (value not drawn)
LED527  16-213/BHC-AN1P2/3T  [LED0402-R-RD]  (value not drawn)
LED528  16-213/BHC-AN1P2/3T  [LED0402-R-RD]  (value not drawn)
LED529  16-213/BHC-AN1P2/3T  [LED0402-R-RD]  (value not drawn)
LED530  16-213/BHC-AN1P2/3T  [LED0402-R-RD]  (value not drawn)
LED531  16-213/BHC-AN1P2/3T  [LED0402-R-RD]  (value not drawn)
LED532  16-213/BHC-AN1P2/3T  [LED0402-R-RD]  (value not drawn)
LED533  16-213/BHC-AN1P2/3T  [LED0402-R-RD]  (value not drawn)
LED534  16-213/BHC-AN1P2/3T  [LED0402-R-RD]  (value not drawn)
LED535  16-213/BHC-AN1P2/3T  [LED0402-R-RD]  (value not drawn)
LED536  16-213/BHC-AN1P2/3T  [LED0402-R-RD]  (value not drawn)
LED537  16-213/BHC-AN1P2/3T  [LED0402-R-RD]  (value not drawn)
LED538  16-213/BHC-AN1P2/3T  [LED0402-R-RD]  (value not drawn)
LED539  16-213/BHC-AN1P2/3T  [LED0402-R-RD]  (value not drawn)
LED540  16-213/BHC-AN1P2/3T  [LED0402-R-RD]  (value not drawn)
LED541  16-213/BHC-AN1P2/3T  [LED0402-R-RD]  (value not drawn)
LED542  16-213/BHC-AN1P2/3T  [LED0402-R-RD]  (value not drawn)
LED543  16-213/BHC-AN1P2/3T  [LED0402-R-RD]  (value not drawn)
LED544  16-213/BHC-AN1P2/3T  [LED0402-R-RD]  (value not drawn)
LED545  16-213/BHC-AN1P2/3T  [LED0402-R-RD]  (value not drawn)
LED546  16-213/BHC-AN1P2/3T  [LED0402-R-RD]  (value not drawn)
LED547  16-213/BHC-AN1P2/3T  [LED0402-R-RD]  (value not drawn)
LED548  16-213/BHC-AN1P2/3T  [LED0402-R-RD]  (value not drawn)
LED549  16-213/BHC-AN1P2/3T  [LED0402-R-RD]  (value not drawn)
LED550  16-213/BHC-AN1P2/3T  [LED0402-R-RD]  (value not drawn)
LED551  16-213/BHC-AN1P2/3T  [LED0402-R-RD]  (value not drawn)
LED552  16-213/BHC-AN1P2/3T  [LED0402-R-RD]  (value not drawn)
LED553  16-213/BHC-AN1P2/3T  [LED0402-R-RD]  (value not drawn)
LED554  16-213/BHC-AN1P2/3T  [LED0402-R-RD]  (value not drawn)
LED555  16-213/BHC-AN1P2/3T  [LED0402-R-RD]  (value not drawn)
LED556  16-213/BHC-AN1P2/3T  [LED0402-R-RD]  (value not drawn)
LED557  16-213/BHC-AN1P2/3T  [LED0402-R-RD]  (value not drawn)
LED558  16-213/BHC-AN1P2/3T  [LED0402-R-RD]  (value not drawn)
LED559  16-213/BHC-AN1P2/3T  [LED0402-R-RD]  (value not drawn)
LED560  16-213/BHC-AN1P2/3T  [LED0402-R-RD]  (value not drawn)
LED561  16-213/BHC-AN1P2/3T  [LED0402-R-RD]  (value not drawn)
LED562  16-213/BHC-AN1P2/3T  [LED0402-R-RD]  (value not drawn)
LED563  16-213/BHC-AN1P2/3T  [LED0402-R-RD]  (value not drawn)
LED564  16-213/BHC-AN1P2/3T  [LED0402-R-RD]  (value not drawn)
LED565  16-213/BHC-AN1P2/3T  [LED0402-R-RD]  (value not drawn)
LED566  16-213/BHC-AN1P2/3T  [LED0402-R-RD]  (value not drawn)
LED567  16-213/BHC-AN1P2/3T  [LED0402-R-RD]  (value not drawn)
LED568  16-213/BHC-AN1P2/3T  [LED0402-R-RD]  (value not drawn)
LED569  16-213/BHC-AN1P2/3T  [LED0402-R-RD]  (value not drawn)
LED570  16-213/BHC-AN1P2/3T  [LED0402-R-RD]  (value not drawn)
LED571  16-213/BHC-AN1P2/3T  [LED0402-R-RD]  (value not drawn)
LED572  16-213/BHC-AN1P2/3T  [LED0402-R-RD]  (value not drawn)
LED573  16-213/BHC-AN1P2/3T  [LED0402-R-RD]  (value not drawn)
LED574  16-213/BHC-AN1P2/3T  [LED0402-R-RD]  (value not drawn)
LED575  16-213/BHC-AN1P2/3T  [LED0402-R-RD]  (value not drawn)
LED576  16-213/BHC-AN1P2/3T  [LED0402-R-RD]  (value not drawn)
LED577  16-213/BHC-AN1P2/3T  [LED0402-R-RD]  (value not drawn)
LED578  16-213/BHC-AN1P2/3T  [LED0402-R-RD]  (value not drawn)
LED579  16-213/BHC-AN1P2/3T  [LED0402-R-RD]  (value not drawn)
LED580  16-213/BHC-AN1P2/3T  [LED0402-R-RD]  (value not drawn)
LED581  16-213/BHC-AN1P2/3T  [LED0402-R-RD]  (value not drawn)
LED582  16-213/BHC-AN1P2/3T  [LED0402-R-RD]  (value not drawn)
LED583  16-213/BHC-AN1P2/3T  [LED0402-R-RD]  (value not drawn)
LED584  16-213/BHC-AN1P2/3T  [LED0402-R-RD]  (value not drawn)
LED585  16-213/BHC-AN1P2/3T  [LED0402-R-RD]  (value not drawn)
LED586  16-213/BHC-AN1P2/3T  [LED0402-R-RD]  (value not drawn)
LED587  16-213/BHC-AN1P2/3T  [LED0402-R-RD]  (value not drawn)
LED588  16-213/BHC-AN1P2/3T  [LED0402-R-RD]  (value not drawn)
LED589  16-213/BHC-AN1P2/3T  [LED0402-R-RD]  (value not drawn)
LED590  16-213/BHC-AN1P2/3T  [LED0402-R-RD]  (value not drawn)
LED591  16-213/BHC-AN1P2/3T  [LED0402-R-RD]  (value not drawn)
LED592  16-213/BHC-AN1P2/3T  [LED0402-R-RD]  (value not drawn)
LED593  16-213/BHC-AN1P2/3T  [LED0402-R-RD]  (value not drawn)
LED594  16-213/BHC-AN1P2/3T  [LED0402-R-RD]  (value not drawn)
LED595  16-213/BHC-AN1P2/3T  [LED0402-R-RD]  (value not drawn)
LED596  16-213/BHC-AN1P2/3T  [LED0402-R-RD]  (value not drawn)
LED597  16-213/BHC-AN1P2/3T  [LED0402-R-RD]  (value not drawn)
LED598  16-213/BHC-AN1P2/3T  [LED0402-R-RD]  (value not drawn)
LED599  16-213/BHC-AN1P2/3T  [LED0402-R-RD]  (value not drawn)
LED600  16-213/BHC-AN1P2/3T  [LED0402-R-RD]  (value not drawn)
LED601  16-213/BHC-AN1P2/3T  [LED0402-R-RD]  (value not drawn)
LED602  16-213/BHC-AN1P2/3T  [LED0402-R-RD]  (value not drawn)
LED603  16-213/BHC-AN1P2/3T  [LED0402-R-RD]  (value not drawn)
LED604  16-213/BHC-AN1P2/3T  [LED0402-R-RD]  (value not drawn)
LED605  16-213/BHC-AN1P2/3T  [LED0402-R-RD]  (value not drawn)
LED606  16-213/BHC-AN1P2/3T  [LED0402-R-RD]  (value not drawn)
LED607  16-213/BHC-AN1P2/3T  [LED0402-R-RD]  (value not drawn)
LED608  16-213/BHC-AN1P2/3T  [LED0402-R-RD]  (value not drawn)
LED609  16-213/BHC-AN1P2/3T  [LED0402-R-RD]  (value not drawn)
LED610  16-213/BHC-AN1P2/3T  [LED0402-R-RD]  (value not drawn)
LED611  16-213/BHC-AN1P2/3T  [LED0402-R-RD]  (value not drawn)
LED612  16-213/BHC-AN1P2/3T  [LED0402-R-RD]  (value not drawn)
LED613  16-213/BHC-AN1P2/3T  [LED0402-R-RD]  (value not drawn)
LED614  16-213/BHC-AN1P2/3T  [LED0402-R-RD]  (value not drawn)
LED615  16-213/BHC-AN1P2/3T  [LED0402-R-RD]  (value not drawn)
LED616  16-213/BHC-AN1P2/3T  [LED0402-R-RD]  (value not drawn)
LED617  16-213/BHC-AN1P2/3T  [LED0402-R-RD]  (value not drawn)
LED618  16-213/BHC-AN1P2/3T  [LED0402-R-RD]  (value not drawn)
LED619  16-213/BHC-AN1P2/3T  [LED0402-R-RD]  (value not drawn)
LED620  16-213/BHC-AN1P2/3T  [LED0402-R-RD]  (value not drawn)
LED621  16-213/BHC-AN1P2/3T  [LED0402-R-RD]  (value not drawn)
LED622  16-213/BHC-AN1P2/3T  [LED0402-R-RD]  (value not drawn)
LED623  16-213/BHC-AN1P2/3T  [LED0402-R-RD]  (value not drawn)
LED624  16-213/BHC-AN1P2/3T  [LED0402-R-RD]  (value not drawn)
LED625  16-213/BHC-AN1P2/3T  [LED0402-R-RD]  (value not drawn)
LED626  16-213/BHC-AN1P2/3T  [LED0402-R-RD]  (value not drawn)
LED627  16-213/BHC-AN1P2/3T  [LED0402-R-RD]  (value not drawn)
LED628  16-213/BHC-AN1P2/3T  [LED0402-R-RD]  (value not drawn)
LED629  16-213/BHC-AN1P2/3T  [LED0402-R-RD]  (value not drawn)
LED630  16-213/BHC-AN1P2/3T  [LED0402-R-RD]  (value not drawn)
LED631  16-213/BHC-AN1P2/3T  [LED0402-R-RD]  (value not drawn)
LED632  16-213/BHC-AN1P2/3T  [LED0402-R-RD]  (value not drawn)
LED633  16-213/BHC-AN1P2/3T  [LED0402-R-RD]  (value not drawn)
LED634  16-213/BHC-AN1P2/3T  [LED0402-R-RD]  (value not drawn)
LED635  16-213/BHC-AN1P2/3T  [LED0402-R-RD]  (value not drawn)
LED636  16-213/BHC-AN1P2/3T  [LED0402-R-RD]  (value not drawn)
LED637  16-213/BHC-AN1P2/3T  [LED0402-R-RD]  (value not drawn)
LED638  16-213/BHC-AN1P2/3T  [LED0402-R-RD]  (value not drawn)
LED639  16-213/BHC-AN1P2/3T  [LED0402-R-RD]  (value not drawn)
LED640  16-213/BHC-AN1P2/3T  [LED0402-R-RD]  (value not drawn)
LED641  16-213/BHC-AN1P2/3T  [LED0402-R-RD]  (value not drawn)
LED642  16-213/BHC-AN1P2/3T  [LED0402-R-RD]  (value not drawn)
LED643  16-213/BHC-AN1P2/3T  [LED0402-R-RD]  (value not drawn)
LED644  16-213/BHC-AN1P2/3T  [LED0402-R-RD]  (value not drawn)
LED645  16-213/BHC-AN1P2/3T  [LED0402-R-RD]  (value not drawn)
LED646  16-213/BHC-AN1P2/3T  [LED0402-R-RD]  (value not drawn)
LED647  16-213/BHC-AN1P2/3T  [LED0402-R-RD]  (value not drawn)
LED648  16-213/BHC-AN1P2/3T  [LED0402-R-RD]  (value not drawn)
LED649  16-213/BHC-AN1P2/3T  [LED0402-R-RD]  (value not drawn)
LED650  16-213/BHC-AN1P2/3T  [LED0402-R-RD]  (value not drawn)
LED651  16-213/BHC-AN1P2/3T  [LED0402-R-RD]  (value not drawn)
LED652  16-213/BHC-AN1P2/3T  [LED0402-R-RD]  (value not drawn)
LED653  16-213/BHC-AN1P2/3T  [LED0402-R-RD]  (value not drawn)
LED654  16-213/BHC-AN1P2/3T  [LED0402-R-RD]  (value not drawn)
LED655  16-213/BHC-AN1P2/3T  [LED0402-R-RD]  (value not drawn)
LED656  16-213/BHC-AN1P2/3T  [LED0402-R-RD]  (value not drawn)
LED657  16-213/BHC-AN1P2/3T  [LED0402-R-RD]  (value not drawn)
LED658  16-213/BHC-AN1P2/3T  [LED0402-R-RD]  (value not drawn)
LED659  16-213/BHC-AN1P2/3T  [LED0402-R-RD]  (value not drawn)
LED660  16-213/BHC-AN1P2/3T  [LED0402-R-RD]  (value not drawn)
LED661  16-213/BHC-AN1P2/3T  [LED0402-R-RD]  (value not drawn)
LED662  16-213/BHC-AN1P2/3T  [LED0402-R-RD]  (value not drawn)
LED663  16-213/BHC-AN1P2/3T  [LED0402-R-RD]  (value not drawn)
LED664  16-213/BHC-AN1P2/3T  [LED0402-R-RD]  (value not drawn)
LED665  16-213/BHC-AN1P2/3T  [LED0402-R-RD]  (value not drawn)
LED666  16-213/BHC-AN1P2/3T  [LED0402-R-RD]  (value not drawn)
LED667  16-213/BHC-AN1P2/3T  [LED0402-R-RD]  (value not drawn)
LED668  16-213/BHC-AN1P2/3T  [LED0402-R-RD]  (value not drawn)
LED669  16-213/BHC-AN1P2/3T  [LED0402-R-RD]  (value not drawn)
LED670  16-213/BHC-AN1P2/3T  [LED0402-R-RD]  (value not drawn)
LED671  16-213/BHC-AN1P2/3T  [LED0402-R-RD]  (value not drawn)
LED672  16-213/BHC-AN1P2/3T  [LED0402-R-RD]  (value not drawn)
LED673  16-213/BHC-AN1P2/3T  [LED0402-R-RD]  (value not drawn)
LED674  16-213/BHC-AN1P2/3T  [LED0402-R-RD]  (value not drawn)
LED675  16-213/BHC-AN1P2/3T  [LED0402-R-RD]  (value not drawn)
LED676  16-213/BHC-AN1P2/3T  [LED0402-R-RD]  (value not drawn)
LED677  16-213/BHC-AN1P2/3T  [LED0402-R-RD]  (value not drawn)
LED678  16-213/BHC-AN1P2/3T  [LED0402-R-RD]  (value not drawn)
LED679  16-213/BHC-AN1P2/3T  [LED0402-R-RD]  (value not drawn)
LED680  16-213/BHC-AN1P2/3T  [LED0402-R-RD]  (value not drawn)
LED681  16-213/BHC-AN1P2/3T  [LED0402-R-RD]  (value not drawn)
LED682  16-213/BHC-AN1P2/3T  [LED0402-R-RD]  (value not drawn)
LED683  16-213/BHC-AN1P2/3T  [LED0402-R-RD]  (value not drawn)
LED684  16-213/BHC-AN1P2/3T  [LED0402-R-RD]  (value not drawn)
LED685  16-213/BHC-AN1P2/3T  [LED0402-R-RD]  (value not drawn)
LED686  16-213/BHC-AN1P2/3T  [LED0402-R-RD]  (value not drawn)
LED687  16-213/BHC-AN1P2/3T  [LED0402-R-RD]  (value not drawn)
LED688  16-213/BHC-AN1P2/3T  [LED0402-R-RD]  (value not drawn)
LED689  16-213/BHC-AN1P2/3T  [LED0402-R-RD]  (value not drawn)
LED690  16-213/BHC-AN1P2/3T  [LED0402-R-RD]  (value not drawn)
LED691  16-213/BHC-AN1P2/3T  [LED0402-R-RD]  (value not drawn)
LED692  16-213/BHC-AN1P2/3T  [LED0402-R-RD]  (value not drawn)
LED693  16-213/BHC-AN1P2/3T  [LED0402-R-RD]  (value not drawn)
LED694  16-213/BHC-AN1P2/3T  [LED0402-R-RD]  (value not drawn)
LED695  16-213/BHC-AN1P2/3T  [LED0402-R-RD]  (value not drawn)
LED696  16-213/BHC-AN1P2/3T  [LED0402-R-RD]  (value not drawn)
LED697  16-213/BHC-AN1P2/3T  [LED0402-R-RD]  (value not drawn)
LED698  16-213/BHC-AN1P2/3T  [LED0402-R-RD]  (value not drawn)
LED699  16-213/BHC-AN1P2/3T  [LED0402-R-RD]  (value not drawn)
LED700  16-213/BHC-AN1P2/3T  [LED0402-R-RD]  (value not drawn)
LED701  16-213/BHC-AN1P2/3T  [LED0402-R-RD]  (value not drawn)
LED702  16-213/BHC-AN1P2/3T  [LED0402-R-RD]  (value not drawn)
LED703  16-213/BHC-AN1P2/3T  [LED0402-R-RD]  (value not drawn)
LED704  16-213/BHC-AN1P2/3T  [LED0402-R-RD]  (value not drawn)
LED705  16-213/BHC-AN1P2/3T  [LED0402-R-RD]  (value not drawn)
LED706  16-213/BHC-AN1P2/3T  [LED0402-R-RD]  (value not drawn)
LED707  16-213/BHC-AN1P2/3T  [LED0402-R-RD]  (value not drawn)
LED708  16-213/BHC-AN1P2/3T  [LED0402-R-RD]  (value not drawn)
LED709  16-213/BHC-AN1P2/3T  [LED0402-R-RD]  (value not drawn)
LED710  16-213/BHC-AN1P2/3T  [LED0402-R-RD]  (value not drawn)
LED711  16-213/BHC-AN1P2/3T  [LED0402-R-RD]  (value not drawn)
LED712  16-213/BHC-AN1P2/3T  [LED0402-R-RD]  (value not drawn)
LED713  16-213/BHC-AN1P2/3T  [LED0402-R-RD]  (value not drawn)
LED714  16-213/BHC-AN1P2/3T  [LED0402-R-RD]  (value not drawn)
LED715  16-213/BHC-AN1P2/3T  [LED0402-R-RD]  (value not drawn)
LED716  16-213/BHC-AN1P2/3T  [LED0402-R-RD]  (value not drawn)
LED717  16-213/BHC-AN1P2/3T  [LED0402-R-RD]  (value not drawn)
LED718  16-213/BHC-AN1P2/3T  [LED0402-R-RD]  (value not drawn)
LED719  16-213/BHC-AN1P2/3T  [LED0402-R-RD]  (value not drawn)
LED720  16-213/BHC-AN1P2/3T  [LED0402-R-RD]  (value not drawn)
LED721  16-213/BHC-AN1P2/3T  [LED0402-R-RD]  (value not drawn)
LED722  16-213/BHC-AN1P2/3T  [LED0402-R-RD]  (value not drawn)
LED723  16-213/BHC-AN1P2/3T  [LED0402-R-RD]  (value not drawn)
LED724  16-213/BHC-AN1P2/3T  [LED0402-R-RD]  (value not drawn)
LED725  16-213/BHC-AN1P2/3T  [LED0402-R-RD]  (value not drawn)
LED726  16-213/BHC-AN1P2/3T  [LED0402-R-RD]  (value not drawn)
LED727  16-213/BHC-AN1P2/3T  [LED0402-R-RD]  (value not drawn)
LED728  16-213/BHC-AN1P2/3T  [LED0402-R-RD]  (value not drawn)
LED729  16-213/BHC-AN1P2/3T  [LED0402-R-RD]  (value not drawn)
LED730  16-213/BHC-AN1P2/3T  [LED0402-R-RD]  (value not drawn)
LED731  16-213/BHC-AN1P2/3T  [LED0402-R-RD]  (value not drawn)
LED732  16-213/BHC-AN1P2/3T  [LED0402-R-RD]  (value not drawn)
LED733  16-213/BHC-AN1P2/3T  [LED0402-R-RD]  (value not drawn)
LED734  16-213/BHC-AN1P2/3T  [LED0402-R-RD]  (value not drawn)
LED735  16-213/BHC-AN1P2/3T  [LED0402-R-RD]  (value not drawn)
LED736  16-213/BHC-AN1P2/3T  [LED0402-R-RD]  (value not drawn)
LED737  16-213/BHC-AN1P2/3T  [LED0402-R-RD]  (value not drawn)
LED738  16-213/BHC-AN1P2/3T  [LED0402-R-RD]  (value not drawn)
LED739  16-213/BHC-AN1P2/3T  [LED0402-R-RD]  (value not drawn)
LED740  16-213/BHC-AN1P2/3T  [LED0402-R-RD]  (value not drawn)
LED741  16-213/BHC-AN1P2/3T  [LED0402-R-RD]  (value not drawn)
LED742  16-213/BHC-AN1P2/3T  [LED0402-R-RD]  (value not drawn)
LED743  16-213/BHC-AN1P2/3T  [LED0402-R-RD]  (value not drawn)
LED744  16-213/BHC-AN1P2/3T  [LED0402-R-RD]  (value not drawn)
LED745  16-213/BHC-AN1P2/3T  [LED0402-R-RD]  (value not drawn)
LED746  16-213/BHC-AN1P2/3T  [LED0402-R-RD]  (value not drawn)
LED747  16-213/BHC-AN1P2/3T  [LED0402-R-RD]  (value not drawn)
LED748  16-213/BHC-AN1P2/3T  [LED0402-R-RD]  (value not drawn)
LED749  16-213/BHC-AN1P2/3T  [LED0402-R-RD]  (value not drawn)
LED750  16-213/BHC-AN1P2/3T  [LED0402-R-RD]  (value not drawn)
LED751  16-213/BHC-AN1P2/3T  [LED0402-R-RD]  (value not drawn)
LED752  16-213/BHC-AN1P2/3T  [LED0402-R-RD]  (value not drawn)
LED753  16-213/BHC-AN1P2/3T  [LED0402-R-RD]  (value not drawn)
LED754  16-213/BHC-AN1P2/3T  [LED0402-R-RD]  (value not drawn)
LED755  16-213/BHC-AN1P2/3T  [LED0402-R-RD]  (value not drawn)
LED756  16-213/BHC-AN1P2/3T  [LED0402-R-RD]  (value not drawn)
LED757  16-213/BHC-AN1P2/3T  [LED0402-R-RD]  (value not drawn)
LED758  16-213/BHC-AN1P2/3T  [LED0402-R-RD]  (value not drawn)
LED759  16-213/BHC-AN1P2/3T  [LED0402-R-RD]  (value not drawn)
LED760  16-213/BHC-AN1P2/3T  [LED0402-R-RD]  (value not drawn)
LED761  16-213/BHC-AN1P2/3T  [LED0402-R-RD]  (value not drawn)
LED762  16-213/BHC-AN1P2/3T  [LED0402-R-RD]  (value not drawn)
LED763  16-213/BHC-AN1P2/3T  [LED0402-R-RD]  (value not drawn)
LED764  16-213/BHC-AN1P2/3T  [LED0402-R-RD]  (value not drawn)
LED765  16-213/BHC-AN1P2/3T  [LED0402-R-RD]  (value not drawn)
LED766  16-213/BHC-AN1P2/3T  [LED0402-R-RD]  (value not drawn)
LED767  16-213/BHC-AN1P2/3T  [LED0402-R-RD]  (value not drawn)
LED768  16-213/BHC-AN1P2/3T  [LED0402-R-RD]  (value not drawn)
LED769  16-213/BHC-AN1P2/3T  [LED0402-R-RD]  (value not drawn)
LED770  16-213/BHC-AN1P2/3T  [LED0402-R-RD]  (value not drawn)
LED771  16-213/BHC-AN1P2/3T  [LED0402-R-RD]  (value not drawn)
LED772  16-213/BHC-AN1P2/3T  [LED0402-R-RD]  (value not drawn)
LED773  16-213/BHC-AN1P2/3T  [LED0402-R-RD]  (value not drawn)
LED774  16-213/BHC-AN1P2/3T  [LED0402-R-RD]  (value not drawn)
LED775  16-213/BHC-AN1P2/3T  [LED0402-R-RD]  (value not drawn)
LED776  16-213/BHC-AN1P2/3T  [LED0402-R-RD]  (value not drawn)
LED777  16-213/BHC-AN1P2/3T  [LED0402-R-RD]  (value not drawn)
LED778  16-213/BHC-AN1P2/3T  [LED0402-R-RD]  (value not drawn)
LED779  16-213/BHC-AN1P2/3T  [LED0402-R-RD]  (value not drawn)
LED780  16-213/BHC-AN1P2/3T  [LED0402-R-RD]  (value not drawn)
LED781  16-213/BHC-AN1P2/3T  [LED0402-R-RD]  (value not drawn)
LED782  16-213/BHC-AN1P2/3T  [LED0402-R-RD]  (value not drawn)
LED783  16-213/BHC-AN1P2/3T  [LED0402-R-RD]  (value not drawn)
LED784  16-213/BHC-AN1P2/3T  [LED0402-R-RD]  (value not drawn)
LED785  16-213/BHC-AN1P2/3T  [LED0402-R-RD]  (value not drawn)
LED786  16-213/BHC-AN1P2/3T  [LED0402-R-RD]  (value not drawn)
LED787  16-213/BHC-AN1P2/3T  [LED0402-R-RD]  (value not drawn)